# Altium project MFG01.PrjPcb
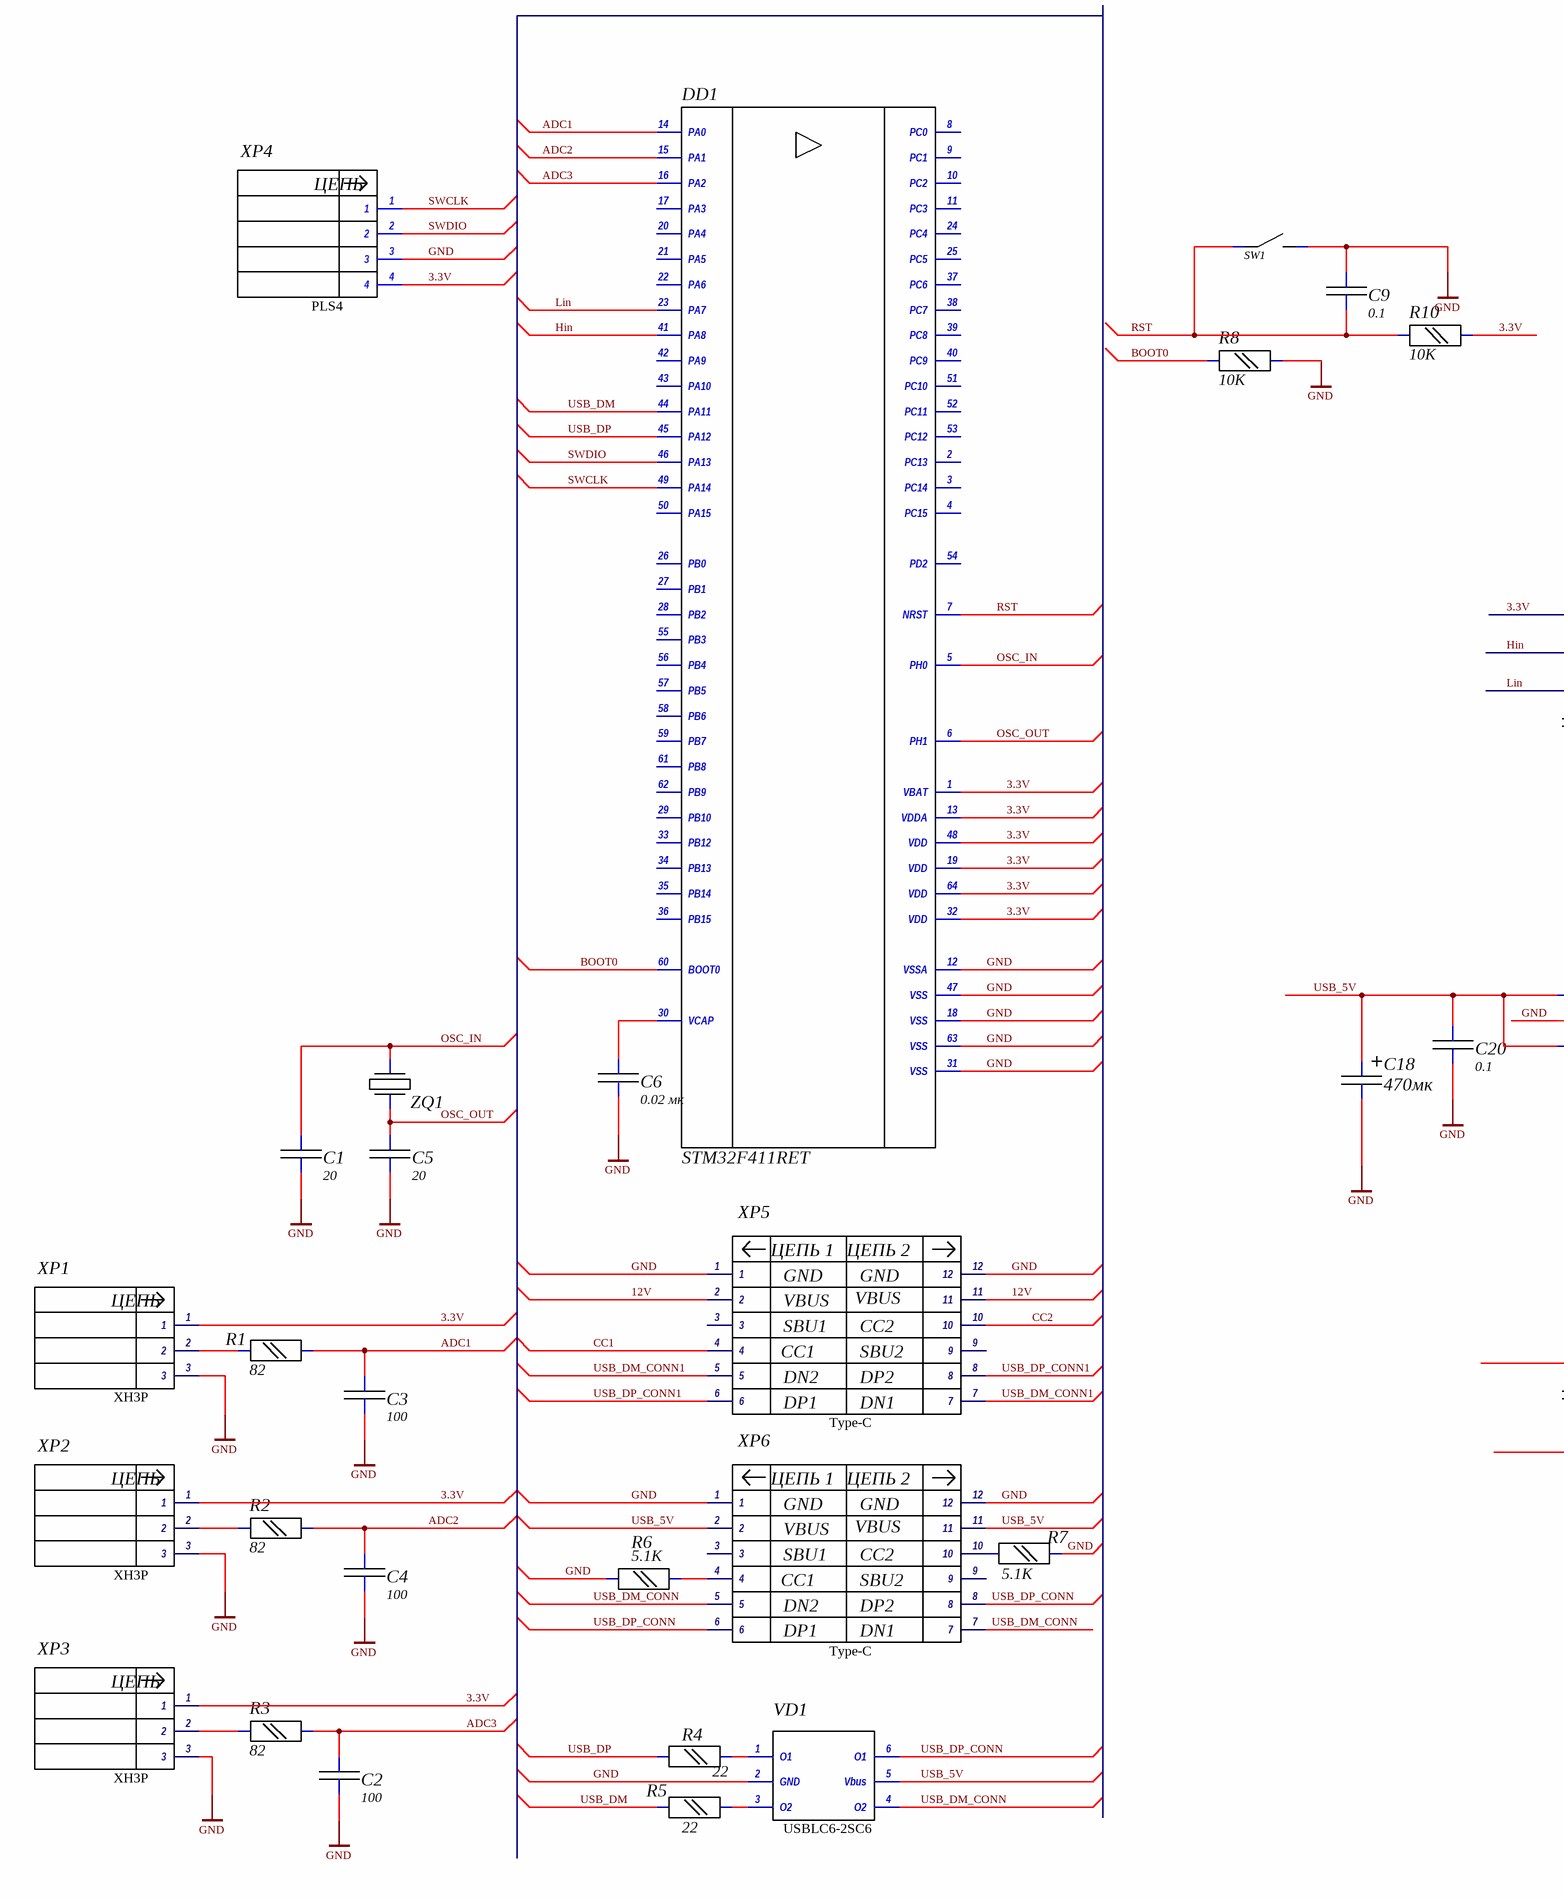
[diagram p0: MFG01_02.SchDoc, left]
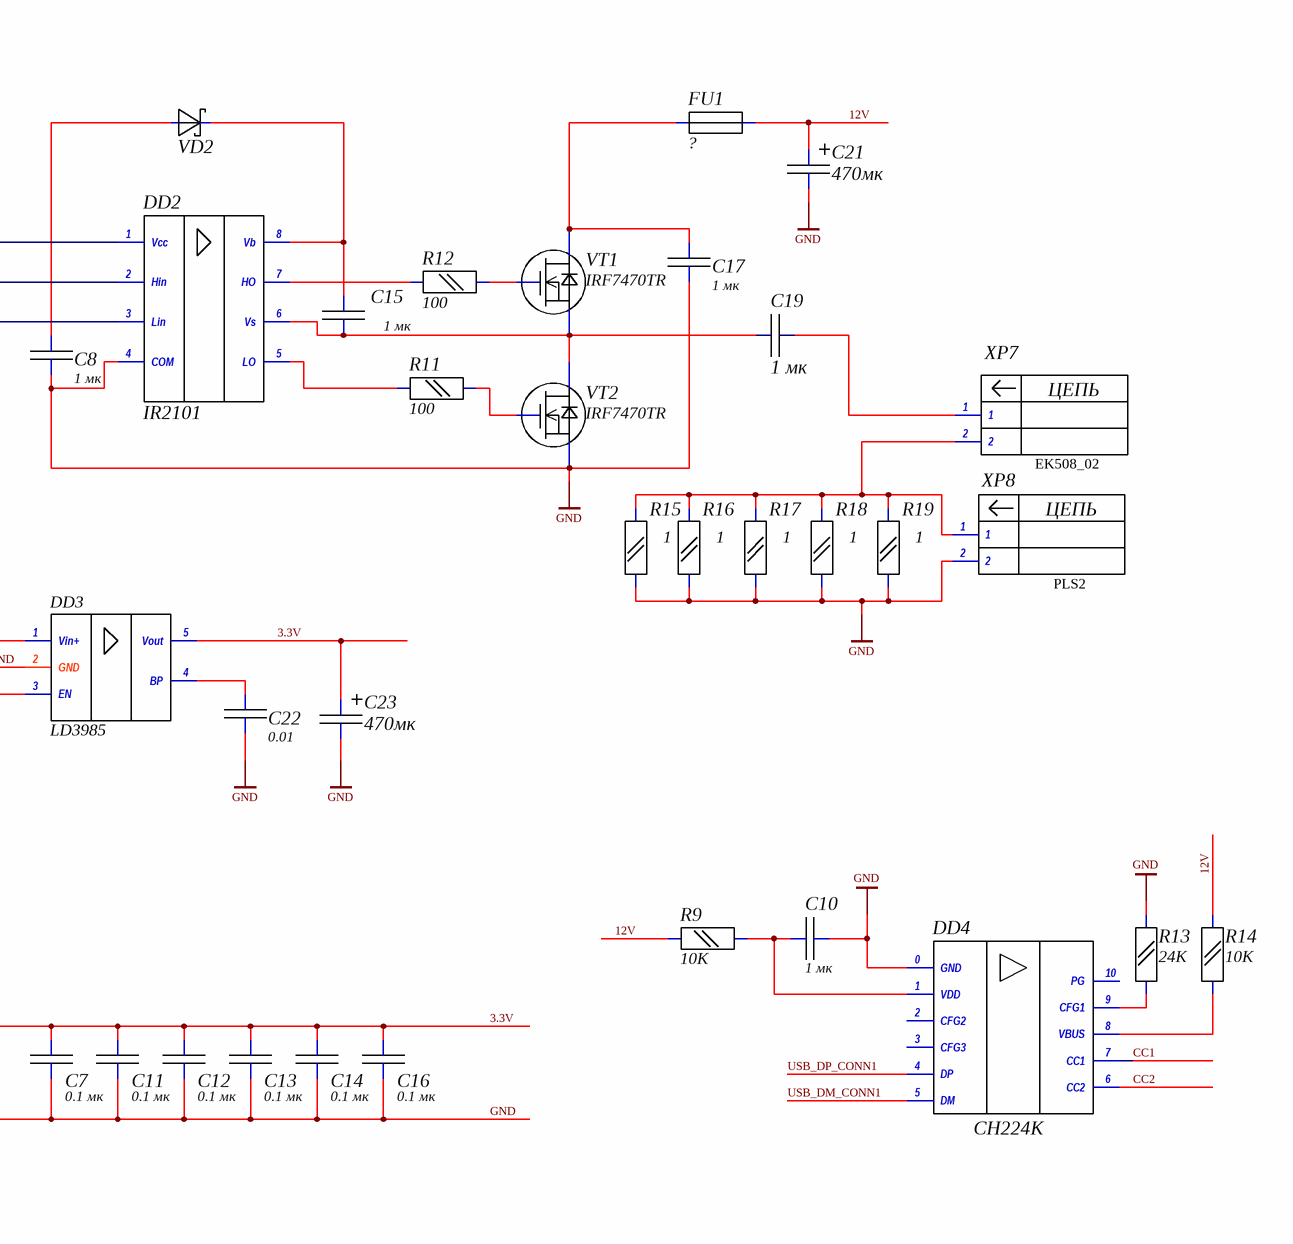
[diagram p1: MFG01_02.SchDoc, right]
1 sheet, 61 parts. Net scope: global (net labels, ports and power ports of the same name join across sheets).
Board file: mfg_v11.PcbDoc

## Sheet MFG01_02.SchDoc
size 594 x 420 mm; Date: 17.10.2026; CheckedBy: Ряцанцев П.Г.; SheetNumber: 1; SheetTotal: 1; ESKD_Designation: MFG01.00.000 Э3; ESKD_Title1: Плата управления катушками; ESKD_Title2: сенсорной перчатки; ESKD_Developer: Маликова А.Р.; ESKD_Organization: МГТУ им. Н.Э. Баумана; ESKD_Group: БМТ2-31М; ESKD_Sheets: 1; ESKD_Version: 1

### Parts
C1  20  [C_0805]
C2  100  [C_0805]
C3  100  [C_0805]
C4  100  [C_0805]
C5  20  [C_0805]
C6  0.02 мк  [C_0805]
C7  0.1 мк  [C_0805]
C8  1 мк  [C_0805]
C9  0.1  [C_0805]
C10  1 мк  [C_0805]
C11  0.1 мк  [C_0805]
C12  0.1 мк  [C_0805]
C13  0.1 мк  [C_0805]
C14  0.1 мк  [C_0805]
C15  1 мк  [C_0805]
C16  0.1 мк  [C_0805]
C17  1 мк  [C_0805]
C18  470мк  [Tantalum B]
C19  1 мк  [FILM CAP 6mm]
C20  0.1  [C_0805]
C21  470мк  [CAPAE1030X1020N]
C22  0.01  [C_0805]
C23  470мк  [Tantalum B]
DD1  STM32F411RET  [LQFP64]
DD2  IR2101  [SOIC8]
DD3  LD3985  [SOT95P280X100-5N]
DD4  CH224K  [SOIC10]
FU1  ?  [FUSE BLOCK 2410]
R1  82  [R_0805]
R2  82  [R_0805]
R3  82  [R_0805]
R4  22  [R_0805]
R5  22  [R_0805]
R6  5.1K  [R_0805]
R7  5.1K  [R_0805]
R8  10K  [R_0805]
R9  10K  [R_0805]
R10  10K  [R_0805]
R11  100  [R_0805]
R12  100  [R_0805]
R13  24K  [R_0805]
R14  10K  [R_0805]
R15  1  [R_1206]
R16  1  [R_1206]
R17  1  [R_1206]
R18  1  [R_1206]
R19  1  [R_1206]
SW1  Tact DTS32  [TACT DTS-32]  (value not drawn)
VD1  USBLC6-2SC6  [SSOT-6]  (value not drawn)
VD2  SS14  [DO-214]  (value not drawn)
VT1  IRF7470TR  [SOIC8]
VT2  IRF7470TR  [SOIC8]
XP1  XH3P  [XH3P]  (value not drawn)
XP2  XH3P  [XH3P]  (value not drawn)
XP3  XH3P  [XH3P]  (value not drawn)
XP4  PLS4  [PLS-4]  (value not drawn)
XP5  Type-C  [TYPE-C]  (value not drawn)
XP6  Type-C  [TYPE-C]  (value not drawn)
XP7  EK508_02  [EK508_02]  (value not drawn)
XP8  PLS2  [PLS-2]  (value not drawn)
ZQ1  NX5032  [NX5032]  (value not drawn)

### Nets
GND: C1.2 C2.2 C3.2 C4.2 C5.2 C6.2 C7.2 C8.2 C9.2 C10.1 C11.2 C12.2 C13.2 C14.2 C16.2 C17.2 C18.2 C20.2 C21.2 C22.2 C23.2 DD1.12(VSSA) DD1.18(VSS) DD1.31(VSS) DD1.47(VSS) DD1.63(VSS) DD2.4(COM) DD3.2(GND) DD4.0(GND) R6.2 R7.1 R8.1 R13.1 R15.1 R16.1 R17.1 R18.1 R19.1 SW1.2 VD1.2(GND) VT2.1,2,3(S) XP1.3 XP2.3 XP3.3 XP4.3 XP5.1 XP5.12 XP6.1 XP6.12 XP8.2
3.3V: C7.1 C11.1 C12.1 C13.1 C14.1 C16.1 C23.1 DD1.1(VBAT) DD1.13(VDDA) DD1.19(VDD) DD1.32(VDD) DD1.48(VDD) DD1.64(VDD) DD2.1(Vcc) DD3.5(Vout) R10.1 XP1.1 XP2.1 XP3.1 XP4.4
12V: C21.1 FU1.2 R9.1 R14.1 XP5.2 XP5.11
ADC1: C3.1 DD1.14(PA0) R1.2
ADC2: C4.1 DD1.15(PA1) R2.2
ADC3: C2.1 DD1.16(PA2) R3.2
BOOT0: DD1.60(BOOT0) R8.2
CC1: DD4.7(CC1) XP5.4
CC2: DD4.6(CC2) XP5.10
Hin: DD1.41(PA8) DD2.2(Hin)
Lin: DD1.23(PA7) DD2.3(Lin)
OSC_IN: C1.1 DD1.5(PH0) ZQ1.2
OSC_OUT: C5.1 DD1.6(PH1) ZQ1.1
RST: C9.1 DD1.7(NRST) R10.2 SW1.1
SWCLK: DD1.49(PA14) XP4.1
SWDIO: DD1.46(PA13) XP4.2
USB_5V: C18.1 C20.1 DD3.1(Vin+) DD3.3(EN) VD1.5(Vbus) XP6.2 XP6.11
USB_DM: DD1.44(PA11) R5.2
USB_DM_CONN: VD1.4(O2) XP6.5 XP6.7
USB_DM_CONN1: DD4.5(DM) XP5.5 XP5.7
USB_DP: DD1.45(PA12) R4.2
USB_DP_CONN: VD1.6(O1) XP6.6 XP6.8
USB_DP_CONN1: DD4.4(DP) XP5.6 XP5.8
NetC6_1: C6.1 DD1.30(VCAP)
NetC8_1: C8.1 VD2.2(А)
NetC10_2: C10.2 DD4.1(VDD) R9.2
NetC15_1: C15.1 DD2.8(Vb) VD2.1(К)
NetC15_2: C15.2 C19.1 DD2.6(Vs) VT1.1,2,3(S) VT2.5,6,7,8(D)
NetC17_1: C17.1 FU1.1 VT1.5,6,7,8(D)
NetC19_2: C19.2 XP7.1
NetC22_1: C22.1 DD3.4(BP)
NetDD2_5: DD2.5(LO) R11.2
NetDD2_7: DD2.7(HO) R12.2
NetDD4_8: DD4.8(VBUS) R14.2
NetDD4_9: DD4.9(CFG1) R13.2
NetR1_1: R1.1 XP1.2
NetR2_1: R2.1 XP2.2
NetR3_1: R3.1 XP3.2
NetR4_1: R4.1 VD1.1(O1)
NetR5_1: R5.1 VD1.3(O2)
NetR6_1: R6.1 XP6.4
NetR7_2: R7.2 XP6.10
NetR11_1: R11.1 VT2.4(G)
NetR12_1: R12.1 VT1.4(G)
NetR15_2: R15.2 R16.2 R17.2 R18.2 R19.2 XP7.2 XP8.1

Not connected (* = marked no-connect by the designer): DD1 2(PC13) 3(PC14) 4(PC15) 8(PC0) 9(PC1) 10(PC2) 11(PC3) 17(PA3) 20(PA4) 21(PA5) 22(PA6) 24(PC4) 25(PC5) 26(PB0) 27(PB1) 28(PB2) 29(PB10) 33(PB12) 34(PB13) 35(PB14) 36(PB15) 37(PC6) 38(PC7) 39(PC8) 40(PC9) 42(PA9) 43(PA10) 50(PA15) 51(PC10) 52(PC11) 53(PC12) 54(PD2) 55(PB3) 56(PB4) 57(PB5) 58(PB6) 59(PB7) 61(PB8) 62(PB9); DD4 2(CFG2) 3(CFG3) 10(PG); XP5 3 9; XP6 3 9

### Notes on the sheet
- Подп. и дата
- Инв. № дубл.
- Взам. инв. №
- Вер.
- Изм.
- Лист
- № докум.
- Подп.
- Дата
- Лит.
- Масса
- Масштаб
- Разраб.
- Пров.
- Т. контр.
- Схема электрическая
- принципиальная
- Листов
- Инв. № подл.
- Н. контр.
- Утв.
- Копировал
- Формат А2
- (in symbol EK508_02) ЦЕПЬ
- (in symbol PLS2) ЦЕПЬ
- (in symbol PLS4) ЦЕПЬ
- (in symbol Type-C) ЦЕПЬ 1; ЦЕПЬ 2; GND; VBUS; SBU1; CC2; CC1; SBU2; DN2; DP2; DP1; DN1
- (in symbol XH3P) ЦЕПЬ

### Library data of the parts
C1 C5 = CAP 0805: Manufacturer_Part_Number: CC0805JRNPO9BN200
C2-C4 = CAP 0805: 100 пФ, C0G, ±5 %, 50 В: CC0805JRNPO9BN101; Manufacturer_Part_Number: CC0805JRNPO9BN101
C6 = CAP 0805
C7 C9 C11-C14 C16 C20 = CAP 0805: Manufacturer_Part_Number: CC0805KRX7R9BB104
C8 C10 C15 C17 = CAP 0805: Manufacturer_Part_Number: CC0805KKX7R8BB105
C18 C23 = Tantalum B
C19 = FILM CAP 6mm: Film capacitor
C21 = El. Cap. D=10mm: Aluminum Electrolytic Capacitor D=10mm
C22 = CAP 0805: Manufacturer_Part_Number: CC0805KRX7R9BB103
DD1 = STM32F411RET_1: Performance line, ARM-based 32-bit MCU; STM32F411RE, LQFP64, исполнение −40…+85 °C: STM32F411RET6; Manufacturer_Part_Number: STM32F411RET6
DD2 = IR2101_1: Half-Bridge, not invert; Manufacturer_Part_Number: IR2101STRPBF
DD3 = LD3985_1: Ultra low drop and low noise BiCMOS voltage regulator
DD4 = CH224K: supports  PD3.0/2.0,  BC1.2  and  other  boost  fast  charging  protocols; Manufacturer_Part_Number: CH224K
FU1 = FUSE SMD 2410: FUSE 2410; Manufacturer_Part_Number: 0451001.MRL
R1-R3 = Resistor SMD 0805: 82 Ом, ±1 %, 0,125 Вт: RC0805FR-0782RL; Manufacturer_Part_Number: RC0805FR-0782RL
R4 R5 = Resistor SMD 0805: 22 Ом, ±1 %, 0,125 Вт: RC0805FR-0722RL; Manufacturer_Part_Number: RC0805FR-0722RL
R6 R7 = Resistor SMD 0805: 5,1 кОм, ±1 %, 0,125 Вт: RC0805FR-075K1L; Manufacturer_Part_Number: RC0805FR-075K1L
R8-R10 R14 = Resistor SMD 0805: Manufacturer_Part_Number: RC0805FR-0710KL
R11 R12 = Resistor SMD 0805: Manufacturer_Part_Number: RC0805FR-07100RL
R13 = Resistor SMD 0805: Manufacturer_Part_Number: RC0805FR-0724KL
R15-R19 = Resistor SMD 1206: Manufacturer_Part_Number: RC1206FR-071RL
VD1 = USBLC6-2SC6: Very low capacitance ESD protection; Защита USB, SOT23-6: USBLC6-2SC6; Manufacturer_Part_Number: USBLC6-2SC6
VD2 = SS14: Schottky Barrier Rectifier; Manufacturer_Part_Number: SS14
VT1 VT2 = IRF7470TR: N-MOSFET 40В 10А 2.5Вт; Manufacturer_Part_Number: IRF7470TRPBF
XP1-XP3 = XH3P: PLS3
ZQ1 = NX5032: Resonator SMD; Manufacturer_Part_Number: NX5032GA-8MHZ-EXS00A-CG03974